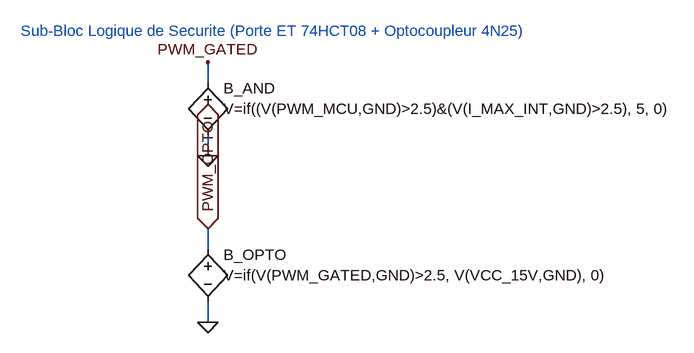
[diagram p0: schematic sub_logique_securite.asc]
sub_logique_securite.asc, the LTspice schematic file:
Version 4
SHEET 1 3200 2400
TEXT 32 32 Left 2 ;Sub-Bloc Logique de Securite (Porte ET 74HCT08 + Optocoupleur 4N25)
SYMBOL bv 320 96 R0
WINDOW 0 24 24 Left 2
WINDOW 3 24 56 Left 2
SYMATTR InstName B_AND
SYMATTR Value V=if((V(PWM_MCU,GND)>2.5)&(V(I_MAX_INT,GND)>2.5), 5, 0)
WIRE 320 112 320 80
FLAG 320 80 PWM_GATED
WIRE 320 192 320 224
FLAG 320 224 0
IOPIN 320 224 BiDir
SYMBOL bv 320 352 R0
WINDOW 0 24 24 Left 2
WINDOW 3 24 56 Left 2
SYMATTR InstName B_OPTO
SYMATTR Value V=if(V(PWM_GATED,GND)>2.5, V(VCC_15V,GND), 0)
WIRE 320 368 320 336
FLAG 320 336 PWM_OPTO
IOPIN 320 336 BiDir
WIRE 320 448 320 480
FLAG 320 480 0
IOPIN 320 480 BiDir

The netlist it stands for:
* sub_logique_securite.asc
B_AND PWM_GATED 0 V=if((V(PWM_MCU,GND)>2.5)&(V(I_MAX_INT,GND)>2.5), 5, 0)
B_OPTO PWM_OPTO 0 V=if(V(PWM_GATED,GND)>2.5, V(VCC_15V,GND), 0)
* Sub-Bloc Logique de Securite (Porte ET 74HCT08 + Optocoupleur 4N25)
.backanno
.end